# Altium project Interface-Board-7500-0428.PrjPcb (part 4 of 4)
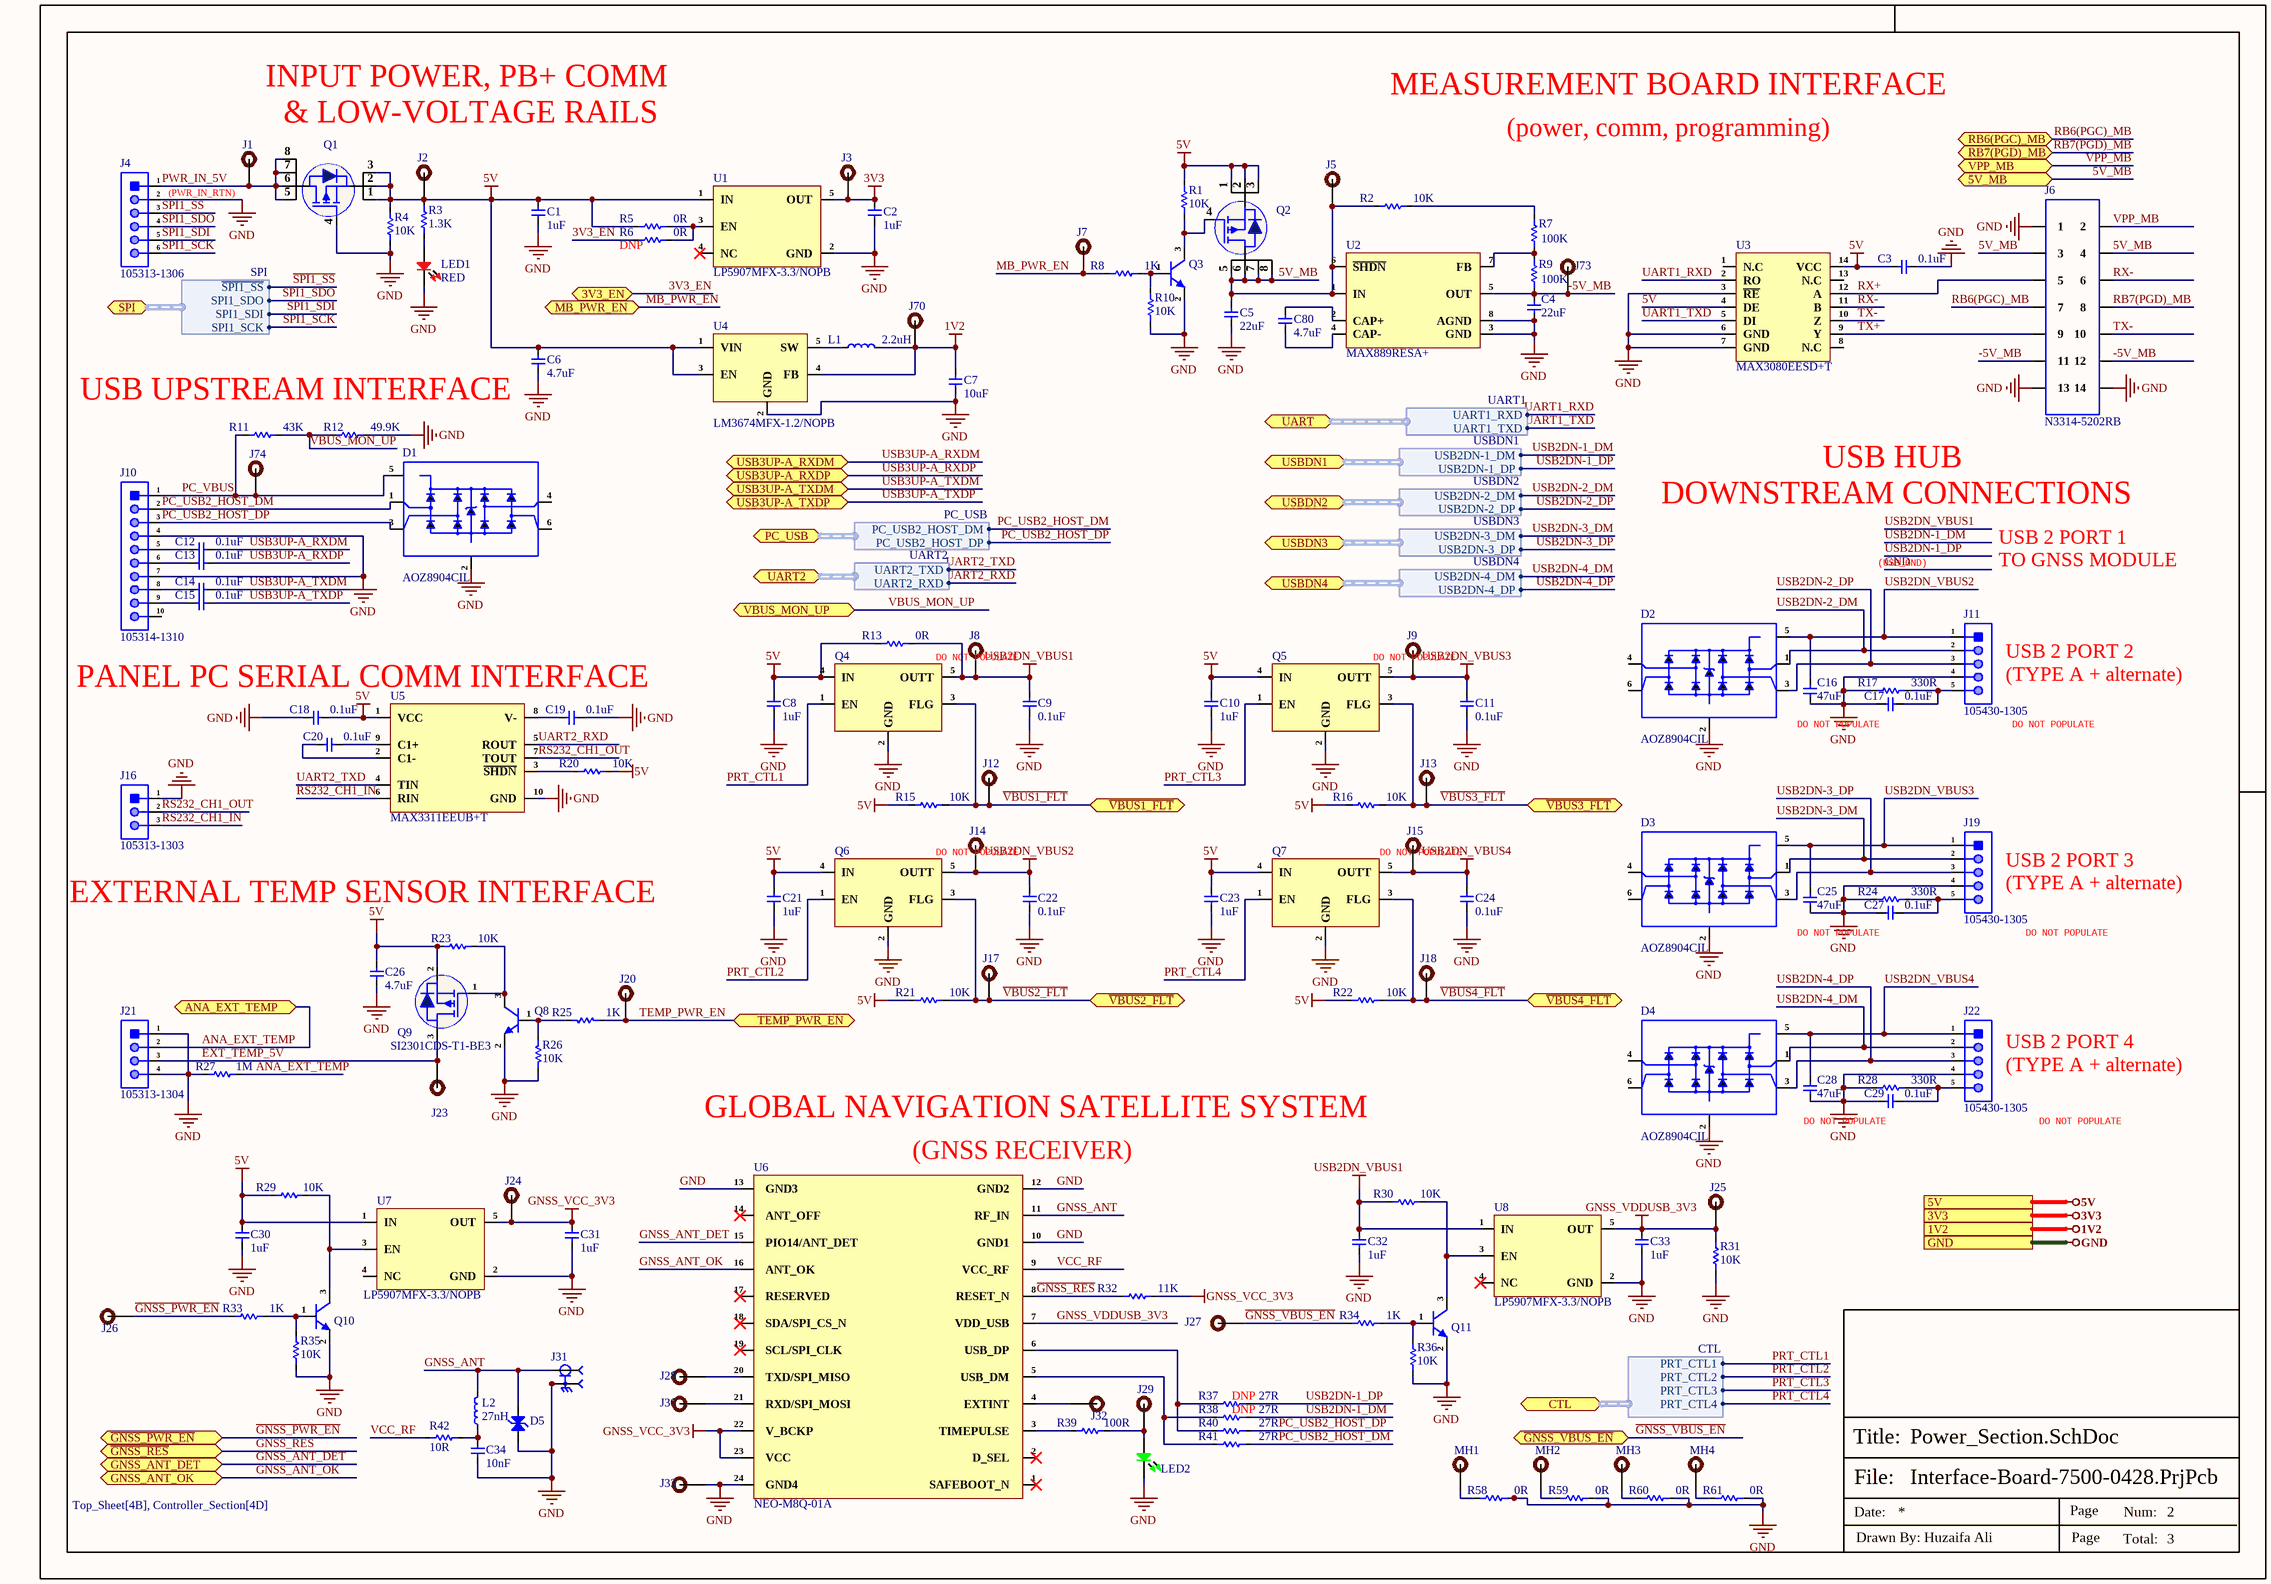
[diagram p5: Power_Section.SchDoc]

## Sheet Power_Section.SchDoc (continued)

### Library data of the parts (continued)
U4 = LM3674MFX-1.2/NOPB: IC REG BUCK 1.2V 600MA SOT23-5; Manufacturer: TI National Semiconductor; Number of Outputs: 1; Min Input Voltage: 2.7V; Max Supply Voltage: 5.5V; Switching Frequency: 2MHz; Synchronous Rectifier: Yes; Quiescent Current: 300uA; Output Type: Fixed; Output Configuration: Positive; Supplier: Mouser; LCSC Part Number: C2071166; Manufacturer Part Number: LM3674MFX-1.2/NOPB; RoHS: Yes; Item Type: IC; Stock: 390; Pricing: 1=1.54, 10=1.38, 50=1.38, 100=1.07, 1000=0.702, 10000=0.599 (USD); Mounting Technology: Surface Mount; Case/Package: SOT-23-5; Pins: 5; Min Operating Temperature: -30°C; Max Operating Temperature: 85°C; Packaging: Tape and Reel; Output Voltage: 1.2V; Max Output current: 600mA; Output Current: 600mA; Package Quantity: 3000; Min Output Voltage: 1.2V; Operating Supply Voltage: 5.5V; Series: -; Radiation Hardening: No; Lead Free: Lead Free; RoHS Compliant: Yes; ComponentLink1URL: http://components.arrow.com/part/dataview/56701705S8560073N1317?src-supplier=Arrow+Electronics; ComponentLink1Description: http://components.arrow.com/part/dataview/56701705S8560073N1317?src-supplier=Arrow+Electronics; ComponentLink2URL: http://www.ti.com/general/docs/suppproductinfo.tsp?distId=10&amp;gotoUrl=http%3A%2F%2Fwww.ti.com%2Flit%2Fgpn%2Flm3674&src-supplier=Digikey; ComponentLink2Description: http://www.ti.com/general/docs/suppproductinfo.tsp?distId=10&amp;gotoUrl=http%3A%2F%2Fwww.ti.com%2Flit%2Fgpn%2Flm3674&src-supplier=Digikey; ComponentLink3URL: http://www.ti.com/lit/gpn/lm3674?src-supplier=Mouser; ComponentLink3Description: http://www.ti.com/lit/gpn/lm3674?src-supplier=Mouser; ComponentLink4URL: http://www.ti.com/lit/ds/symlink/lm3674.pdf?src-supplier=Avnet; ComponentLink4Description: http://www.ti.com/lit/ds/symlink/lm3674.pdf?src-supplier=Avnet; ComponentLink5URL: http://www.ti.com/lit/ds/symlink/lm3674.pdf?src-supplier=Digikey; ComponentLink5Description: http://www.ti.com/lit/ds/symlink/lm3674.pdf?src-supplier=Digikey
U5 = MAX3311EEUB+T: IC TXRX RS232 460KBPS 10-UMAX; Manufacturer: Maxim; Simplex/Duplex: Full Duplex; Receiver Hysteresis: 500mV; Supplier: Digikey; Supplier Part Number: MAX3311EEUB+TCT-ND; Manufacturer Part Number: MAX3311EEUB+T; RoHS: Yes; Category: RS-232 / RS-422 / RS-485 Interface ICs; Stock: 3791; Pricing: 1=5.92, 10=5.32, 25=5.0292, 100=4.3588, 250=4.13524, 500=3.71054, 1000=3.12937 (USD); Mounting Technology: Surface Mount; Case/Package: UMAX; Min Operating Temperature: -40°C; Max Operating Temperature: 85°C; Packaging: Cut Tape; Data Rate: 460Kbps; Series: -; Lead Free: Lead Free; RoHS Compliant: Yes; ComponentLink1URL: https://datasheet.ciiva.com/14430/max3311e-max3313e-14430143.pdf?src-supplier=Avnet; ComponentLink1Description: https://datasheet.ciiva.com/14430/max3311e-max3313e-14430143.pdf?src-supplier=Avnet; ComponentLink2URL: https://datasheet.ciiva.com/1774/max3311e-max3313e-1774738.pdf?src-supplier=Digikey; ComponentLink2Description: https://datasheet.ciiva.com/1774/max3311e-max3313e-1774738.pdf?src-supplier=Digikey; Item Type: IC; Package: MSOP-10; JLCPCB Part Number: C1121855; ComponentLink3Description: JLCPCB; ComponentLink3URL: https://jlcpcb.com/partdetail/1212276-MAX3311EEUBT/C1121855
U6 = NEO-M8Q-01A: Rf Receiver Gnss/gps 1.575GHZ; Manufacturer: u-blox; Item Type: Module; Interface: I2C,SPI,USB,UART; Sensitivity: -167dBm; ComponentLink1URL: https://www.u-blox.com/sites/default/files/NEO-M8Q-01A_DataSheet_%28UBX-15013820%29.pdf?src-supplier=Digikey; ComponentLink1Description: https://www.u-blox.com/sites/default/files/NEO-M8Q-01A_DataSheet_%28UBX-15013820%29.pdf?src-supplier=Digikey; Supplier: Digikey; Supplier Part Number: 672-1174-1-ND; Manufacturer Part Number: NEO-M8Q-01A; RoHS: Yes; Category: RF Receivers, Transceivers; Stock: 322; Pricing: 1=25, 10=20.244 (USD); Mounting Technology: Surface Mount; Case/Package: SMD/SMT; Min Operating Temperature: -40°C; Max Operating Temperature: 105°C; Frequency: 1.575GHz; Series: NEO-M8Q-01A; RoHS Compliant: Yes

## Nets that join several sheets
1V2: Controller_Section (28 pins), Power_Section (C7.2 J70.1 L1.2 U4.4)
3V3: Controller_Section (35 pins), Power_Section (C2.1 J3.1 U1.5)
5V: Controller_Section (15 pins), Power_Section (41 pins)
GND: Controller_Section (63 pins), Power_Section (91 pins)
3V3_EN: Controller_Section (U11.39), Power_Section (R6.1)
5V_MB: Controller_Section (J45.3), Power_Section (11 pins)
ANA_EXT_TEMP: Controller_Section (J62.1 U11.24), Power_Section (J21.2 R27.2)
~{GNSS_PWR_EN}: Controller_Section (U11.22), Power_Section (J26.1 R33.1)
~{GNSS_RES}: Controller_Section (J57.1 U11.17), Power_Section (R32.1 U6.8)
~{GNSS_VBUS_EN}: Controller_Section (U11.15), Power_Section (J27.1 R34.1)
GNSS_ANT_DET: Controller_Section (J58.1 U11.18), Power_Section (U6.15)
GNSS_ANT_OK: Controller_Section (J59.1 U11.21), Power_Section (U6.16)
MB_PWR_EN: Controller_Section (U11.30), Power_Section (J7.1 R8.1)
PC_USB2_HOST_DM: Controller_Section (R50.2), Power_Section (D1.1 J10.2 R41.2)
PC_USB2_HOST_DP: Controller_Section (R51.2), Power_Section (D1.3 J10.3 R40.2)
PRT_CTL1: Controller_Section (U10.60), Power_Section (Q4.1)
PRT_CTL2: Controller_Section (U10.58), Power_Section (Q6.1)
PRT_CTL3: Controller_Section (U10.59), Power_Section (Q5.1)
PRT_CTL4: Controller_Section (U10.56), Power_Section (Q7.1)
RB6(PGC)_MB: Controller_Section (J45.9), Power_Section (J6.7)
RB7(PGD)_MB: Controller_Section (J45.7), Power_Section (J6.8)
~{SPI1_SS}: Controller_Section (J48.1 U11.11), Power_Section (J4.3)
SPI1_SCK: Controller_Section (J54.1 J69.3 U11.34), Power_Section (J4.6)
SPI1_SDI: Controller_Section (J53.1 J69.2 U11.35), Power_Section (J4.5)
SPI1_SDO: Controller_Section (J51.1 J69.1 U11.36), Power_Section (J4.4)
TEMP_PWR_EN: Controller_Section (U11.54), Power_Section (J20.1 R25.1)
UART1_RXD: Controller_Section (J67.1 U11.32), Power_Section (U3.2)
UART1_TXD: Controller_Section (J66.1 U11.31), Power_Section (U3.5)
UART2_RXD: Controller_Section (J47.1 U11.5), Power_Section (U5.5)
UART2_TXD: Controller_Section (J46.1 U11.4), Power_Section (U5.4)
USB2DN-1_DM: Controller_Section (U10.6), Power_Section (R38.2)
USB2DN-1_DP: Controller_Section (U10.5), Power_Section (R37.2)
USB2DN-2_DM: Controller_Section (U10.30), Power_Section (D2.1 J11.2)
USB2DN-2_DP: Controller_Section (U10.29), Power_Section (D2.3 J11.3)
USB2DN-3_DM: Controller_Section (U10.15), Power_Section (D3.1 J19.2)
USB2DN-3_DP: Controller_Section (U10.14), Power_Section (D3.3 J19.3)
USB2DN-4_DM: Controller_Section (U10.38), Power_Section (D4.1 J22.2)
USB2DN-4_DP: Controller_Section (U10.37), Power_Section (D4.3 J22.3)
USB3UP-A_RXDM: Controller_Section (U10.95), Power_Section (C12.2)
USB3UP-A_RXDP: Controller_Section (U10.94), Power_Section (C13.2)
USB3UP-A_TXDM: Controller_Section (U10.92), Power_Section (C14.2)
USB3UP-A_TXDP: Controller_Section (U10.91), Power_Section (C15.2)
~{VBUS1_FLT}: Controller_Section (U11.16), Power_Section (J12.1 Q4.3 R15.1)
~{VBUS2_FLT}: Controller_Section (U11.45), Power_Section (J17.1 Q6.3 R21.1)
~{VBUS3_FLT}: Controller_Section (U11.53), Power_Section (J13.1 Q5.3 R16.1)
~{VBUS4_FLT}: Controller_Section (U11.44), Power_Section (J18.1 Q7.3 R22.1)
VBUS_MON_UP: Controller_Section (U10.80), Power_Section (R11.2 R12.1)
VPP_MB: Controller_Section (J45.1), Power_Section (J6.2)